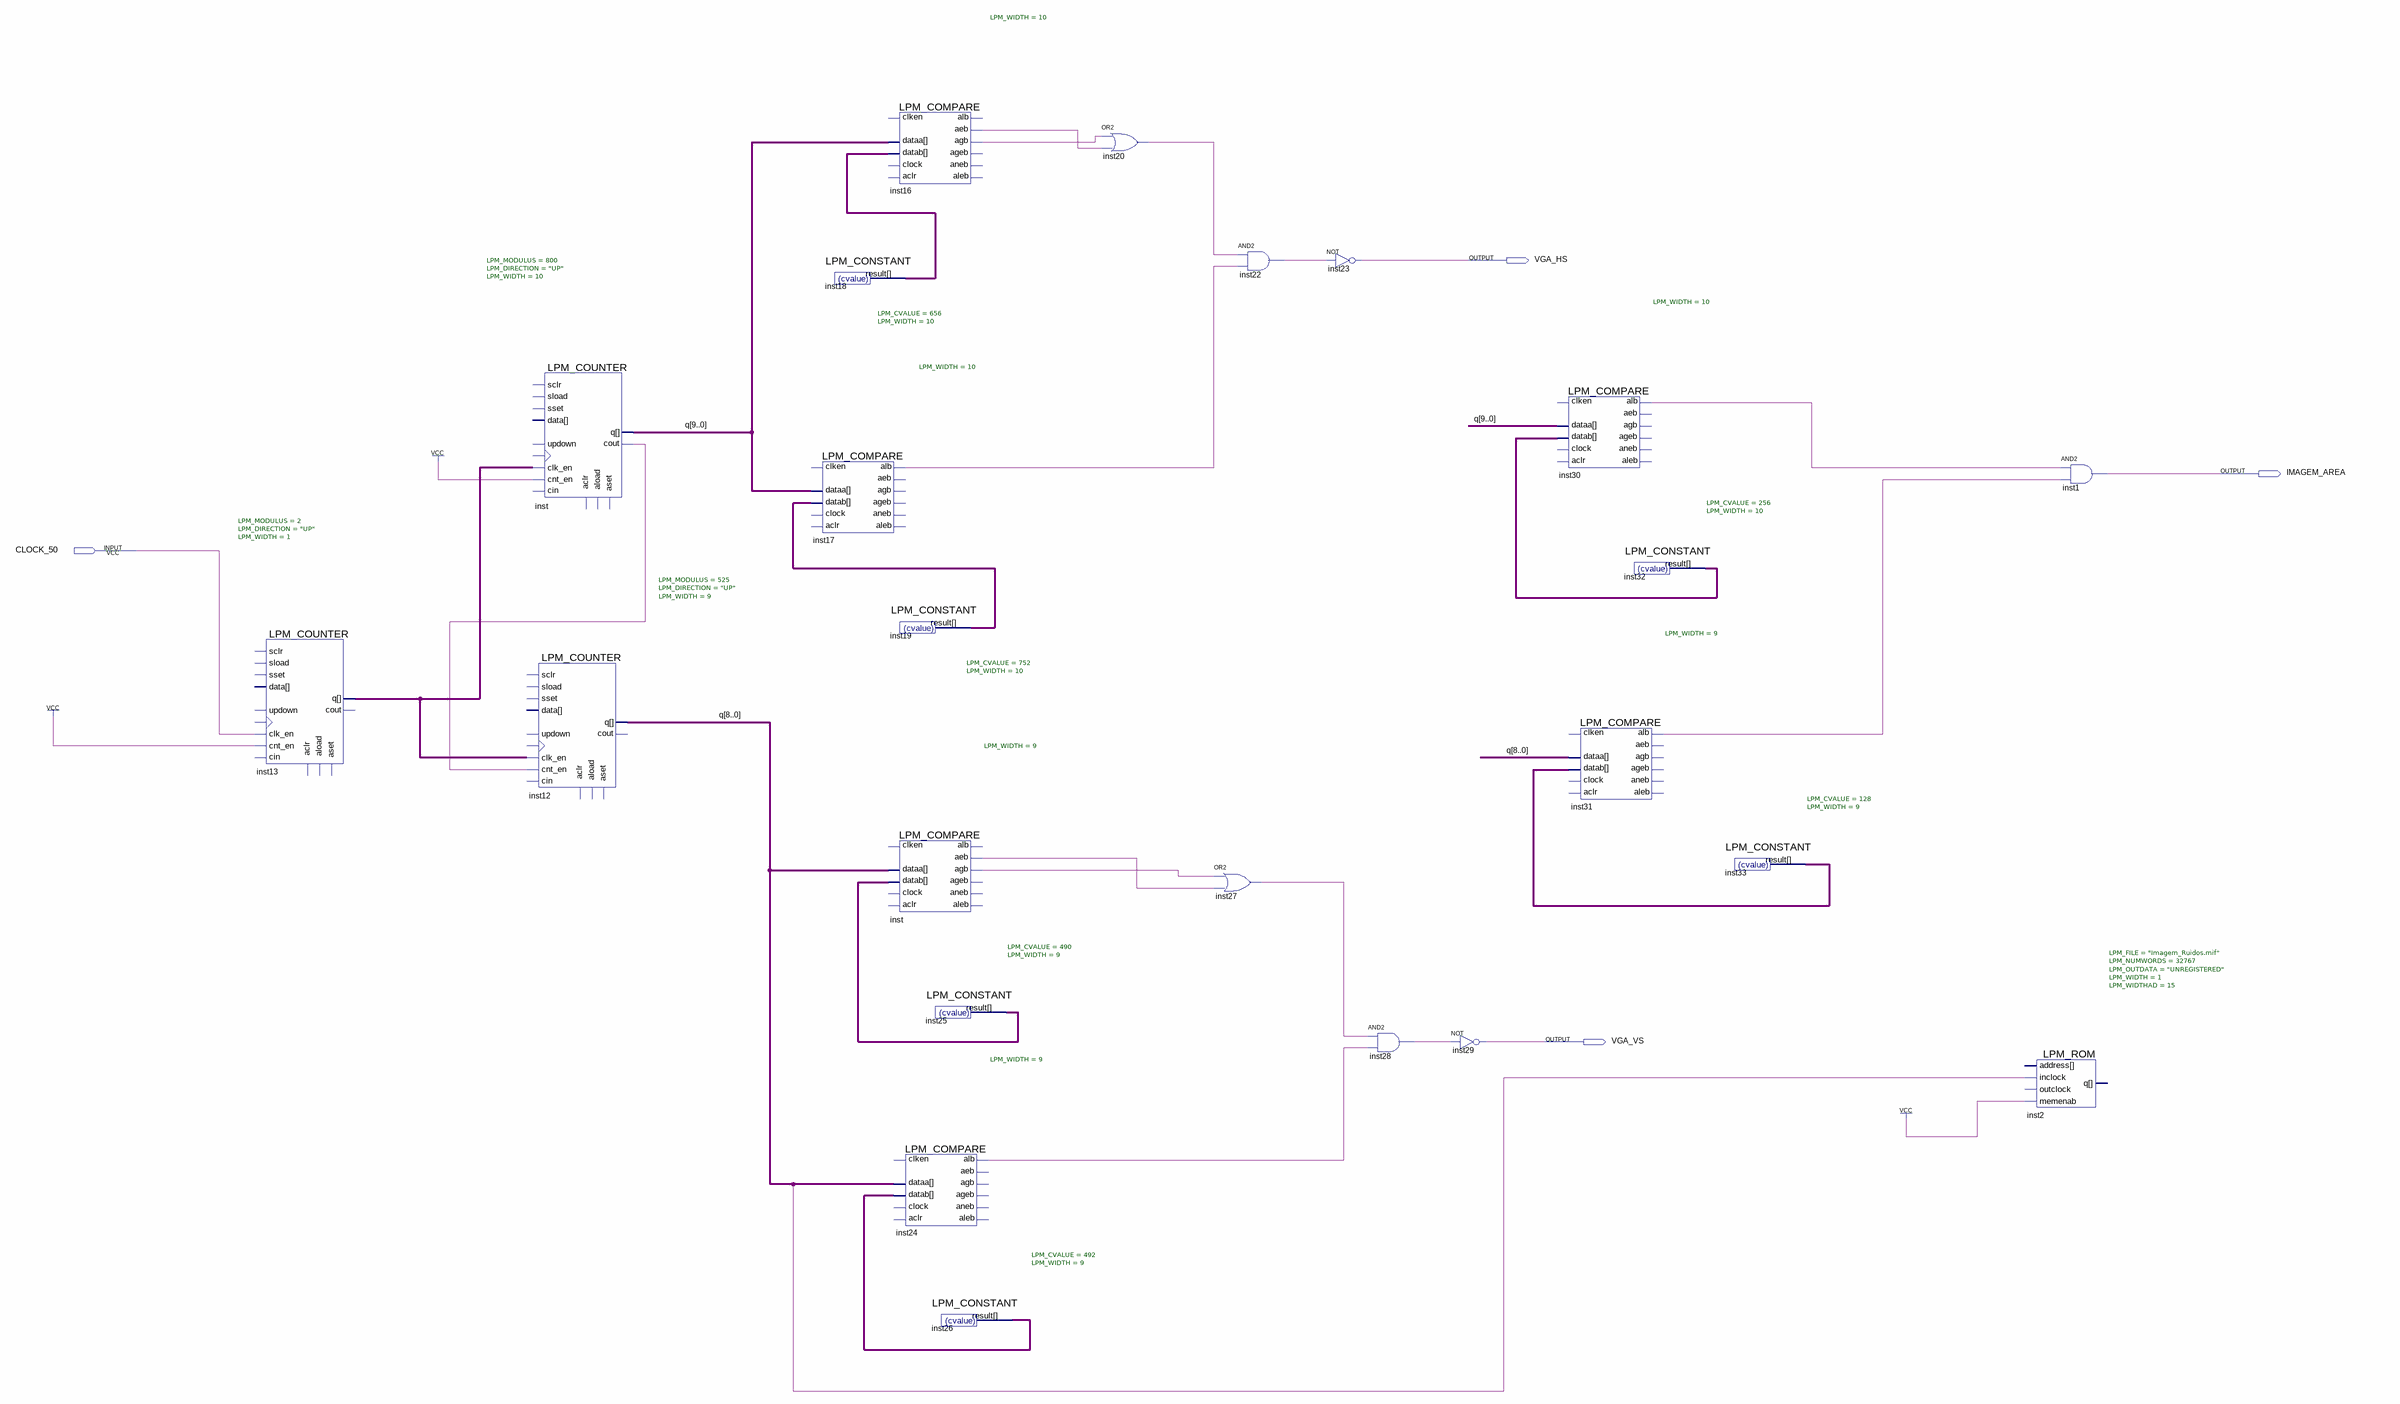
[diagram p0: schematic sheet]
// Quartus schematic Filtro_sem_HDL.bdf as structural Verilog: 23 symbols, 4 pins
module Filtro_sem_HDL (
  input  CLOCK_50,
  output VGA_HS,
  output IMAGEM_AREA,
  output VGA_VS
);

  wire inst13_q, inst16_aeb, inst16_agb, inst17_alb, inst20_out, inst22_out, inst24_alb, inst27_out,
       inst28_out, inst30_alb, inst31_alb, inst_aeb, inst_agb, inst_cout, undriven;
  wire [8:0] inst25_result, inst26_result, inst33_result;
  wire [9:0] inst18_result, inst19_result, inst32_result, q;

  LPM_COUNTER #(.LPM_MODULUS(2), .LPM_DIRECTION("UP"), .LPM_WIDTH(1)) inst13 (
    .clk_en(CLOCK_50), .cnt_en(1'b1), .q(inst13_q));  // open: sload, data, clock, aload, aclr, aset, cin, sset, updown, sclr, cout
  LPM_COUNTER #(.LPM_MODULUS(800), .LPM_DIRECTION("UP"), .LPM_WIDTH(10)) inst (
    .clk_en(inst13_q), .cnt_en(1'b1), .q(q), .cout(inst_cout));  // open: sload, data, clock, aload, aclr, aset, cin, sset, updown, sclr
  LPM_COUNTER #(.LPM_MODULUS(525), .LPM_DIRECTION("UP"), .LPM_WIDTH(9)) inst12 (
    .clk_en(inst13_q), .cnt_en(inst_cout), .q(q[8:0]));  // open: sload, data, clock, aload, aclr, aset, cin, sset, updown, sclr, cout
  LPM_COMPARE #(.LPM_WIDTH(10)) inst17 (
    .dataa(q), .datab(inst19_result), .alb(inst17_alb));  // open: clock, aclr, clken, aleb, aeb, agb, aneb, ageb
  LPM_CONSTANT #(.LPM_CVALUE(656), .LPM_WIDTH(10)) inst18 (.result(inst18_result));
  LPM_COMPARE #(.LPM_WIDTH(10)) inst16 (
    .dataa(q), .datab(inst18_result), .aeb(inst16_aeb), .agb(inst16_agb));  // open: clock, aclr, clken, aleb, aneb, ageb, alb
  LPM_CONSTANT #(.LPM_CVALUE(752), .LPM_WIDTH(10)) inst19 (.result(inst19_result));
  LPM_COMPARE #(.LPM_WIDTH(9)) inst_dup2 (
    .dataa(q[8:0]), .datab(inst25_result), .aeb(inst_aeb), .agb(inst_agb));  // open: clock, aclr, clken, aleb, aneb, ageb, alb
  LPM_COMPARE #(.LPM_WIDTH(9)) inst24 (
    .dataa(q[8:0]), .datab(inst26_result), .alb(inst24_alb));  // open: clock, aclr, clken, aleb, aeb, agb, aneb, ageb
  LPM_CONSTANT #(.LPM_CVALUE(490), .LPM_WIDTH(9)) inst25 (.result(inst25_result));
  LPM_CONSTANT #(.LPM_CVALUE(492), .LPM_WIDTH(9)) inst26 (.result(inst26_result));
  or inst20 (inst20_out, inst16_agb, inst16_aeb);
  and inst22 (inst22_out, inst20_out, inst17_alb);
  or inst27 (inst27_out, inst_agb, inst_aeb);
  not inst23 (VGA_HS, inst22_out);
  and inst28 (inst28_out, inst27_out, inst24_alb);
  not inst29 (VGA_VS, inst28_out);
  LPM_COMPARE #(.LPM_WIDTH(10)) inst30 (
    .dataa(q), .datab(inst32_result), .alb(inst30_alb));  // open: clock, aclr, clken, aleb, aeb, agb, aneb, ageb
  LPM_COMPARE #(.LPM_WIDTH(9)) inst31 (
    .dataa(q[8:0]), .datab(inst33_result), .alb(inst31_alb));  // open: clock, aclr, clken, aleb, aeb, agb, aneb, ageb
  LPM_CONSTANT #(.LPM_CVALUE(256), .LPM_WIDTH(10)) inst32 (.result(inst32_result));
  LPM_CONSTANT #(.LPM_CVALUE(128), .LPM_WIDTH(9)) inst33 (.result(inst33_result));
  LPM_ROM #(.LPM_FILE("Imagem_Ruidos.mif"), .LPM_NUMWORDS(32767), .LPM_OUTDATA("UNREGISTERED"), .LPM_WIDTH(1), .LPM_WIDTHAD(15)) inst2 (
    .inclock(undriven), .memenab(1'b1));  // open: address, outclock, q
  and inst1 (IMAGEM_AREA, inst30_alb, inst31_alb);
endmodule
